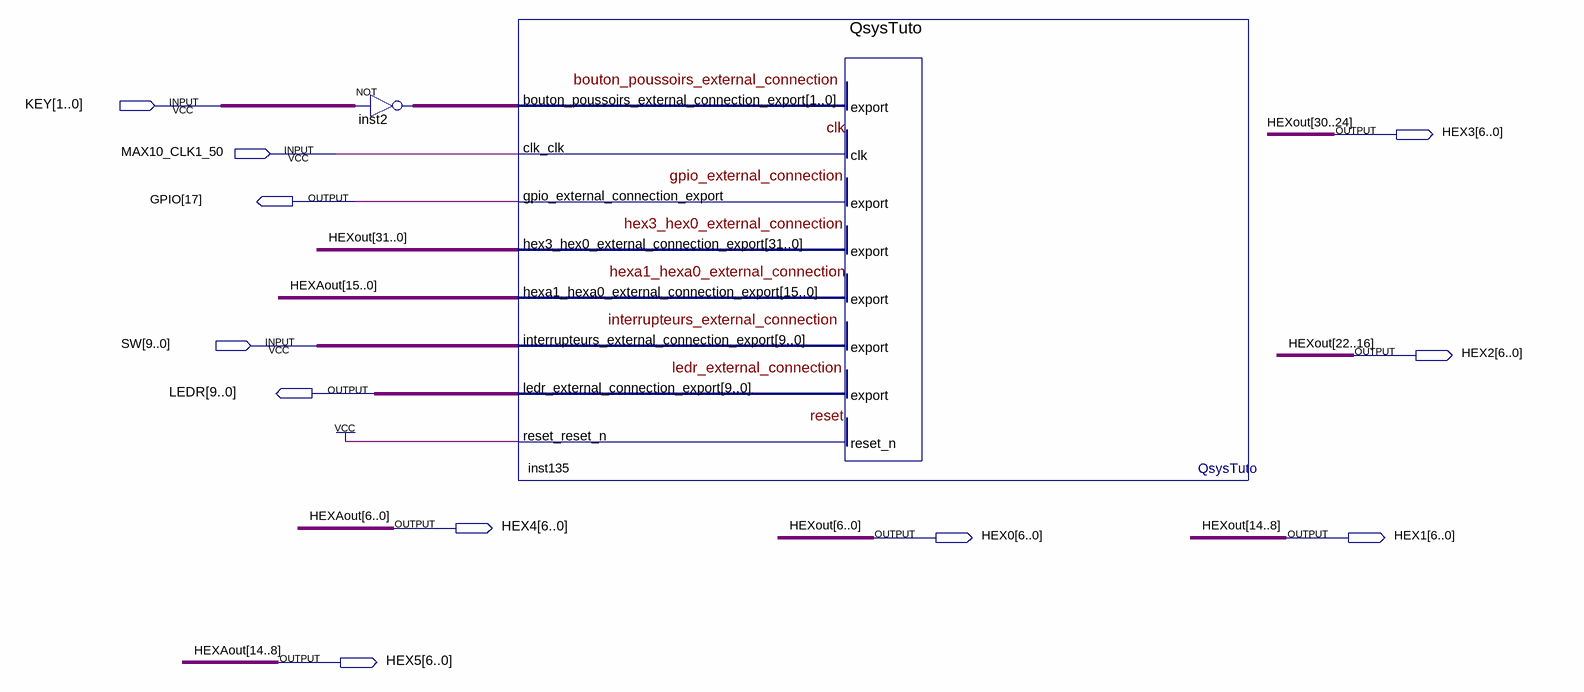
[diagram p0: schematic sheet]
// Quartus schematic TD_SNE.bdf as structural Verilog: 2 symbols, 11 pins
module TD_SNE (
  input  [1:0] KEY,
  input  MAX10_CLK1_50,
  input  [9:0] SW,
  output [6:0] HEX3,
  output [17:17] GPIO,
  output [6:0] HEX2,
  output [9:0] LEDR,
  output [6:0] HEX4,
  output [6:0] HEX0,
  output [6:0] HEX1,
  output [6:0] HEX5
);

  wire [1:0] inst2_out;
  wire [15:7] HEXAout;
  wire [31:7] HEXout;

  assign inst2_out = ~KEY;  // NOT inst2, 2 bits wide
  QsysTuto inst135 (
    .bouton_poussoirs_external_connection_export(inst2_out), .clk_clk(MAX10_CLK1_50),
    .interrupteurs_external_connection_export(SW), .reset_reset_n(1'b1),
    .gpio_external_connection_export(GPIO[17]),
    .hex3_hex0_external_connection_export({HEXout[31], HEX3, HEXout[23], HEX2, HEXout[15], HEX1, HEXout[7], HEX0}),
    .hexa1_hexa0_external_connection_export({HEXAout[15], HEX5, HEXAout[7], HEX4}),
    .ledr_external_connection_export(LEDR));

  // Other names for the same wires on the sheet: HEXAout (some bits) = {HEX5, HEX4};
  //   HEXout (some bits) = {HEX3, HEX2, HEX1, HEX0}
endmodule
